# Altium schematic sheet FMU_FMU.SchDoc
size A4; SheetNumber: 1; SheetTotal: 5
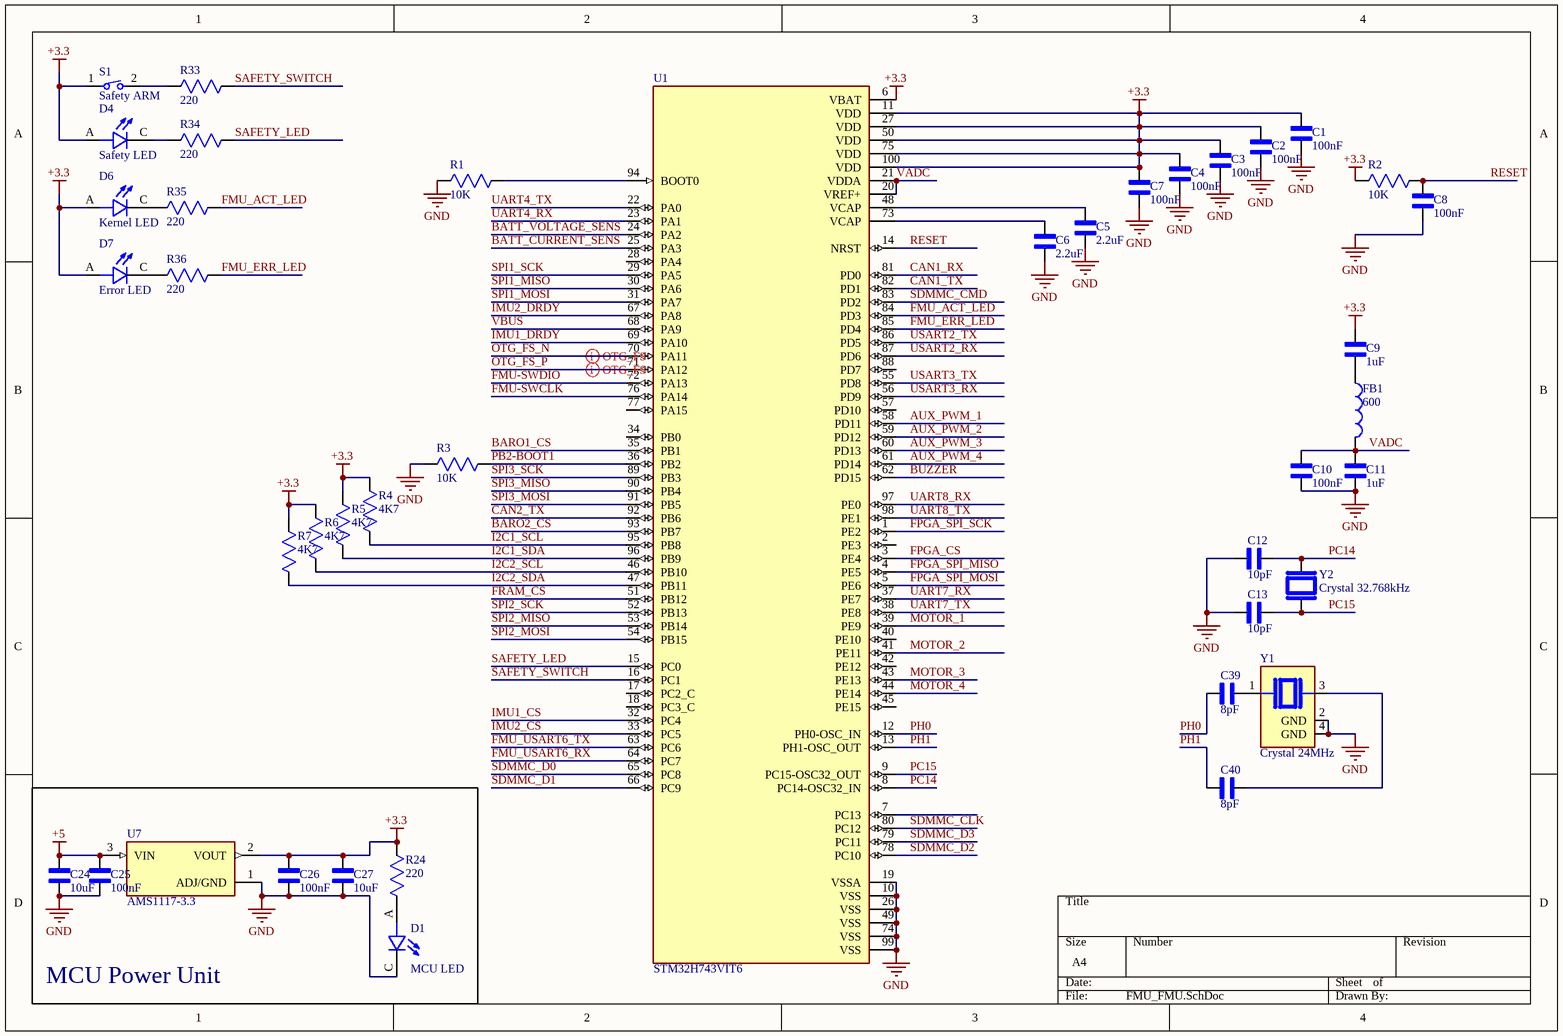
[diagram p0: FMU_FMU.SchDoc]

## Parts
C1  100nF  [CAPC1608X90N]
C2  100nF  [CAPC1608X90N]
C3  100nF  [CAPC1608X90N]
C4  100nF  [CAPC1608X90N]
C5  2.2uF  [CAPC1608X90N]
C6  2.2uF  [CAPC1608X90N]
C7  100nF  [CAPC1608X90N]
C8  100nF  [CAPC3216X127N]
C9  1uF  [CAPC1608X90N]
C10  100nF  [CAPC1608X90N]
C11  1uF  [CAPC1608X90N]
C12  10pF  [CAPC1608X90N]
C13  10pF  [CAPC1608X90N]
C24  10uF  [CAPC3216X110N]
C25  100nF  [CAPC2012X135N]
C26  100nF  [CAPC2012X135N]
C27  10uF  [CAPC3216X110N]
C39  8pF  [CAPC1005X55N]
C40  8pF  [CAPC1005X55N]
D1  MCU LED  [LEDSC125X200X90-2N]
D4  Safety LED  [LEDSC125X200X90-2N]
D6  Kernel LED  [LEDSC125X200X90-2N]
D7  Error LED  [LEDSC125X200X90-2N]
FB1  600  [WE-CBA_0805_W4.0]
R1  10K  [RESC2013X65N]
R2  10K  [RESC2013X65N]
R3  10K  [RESC2013X65N]
R4  4K7  [RESC2013X65N]
R5  4K7  [RESC2013X65N]
R6  4K7  [RESC2013X65N]
R7  4K7  [RESC2013X65N]
R24  220  [RESC2013X65N]
R33  220  [RESC2013X65N]
R34  220  [RESC2013X65N]
R35  220  [RESC2013X65N]
R36  220  [RESC2013X65N]
S1  Safety ARM  [434781025816]
U1  STM32H743VIT6  [QFP50P1600X1600X160-100N]
U7  AMS1117-3.3  [SOT229P700X180-4N]
Y1  Crystal 24MHz  [XTAL_ABM8G-24.000MHZ-B4Y-T]
Y2  Crystal 32.768kHz  [XTAL_CC7V-T1A-32.768KHZ-7PF-100PPM-TA-QC]

## Blocks framed on the sheet
MCU Power Unit: C24-C27 D1 R24 U7

## Nets
+3.3: C1.2 C2.2 C3.2 C4.2 C7.2 C9.2 C26.2 C27.1 D4.A D6.A D7.A R2.2(R2) R4.1(R1) R5.1(R1) R6.1(R1) R7.1(R1) R24.1(R1) S1.1 U1.6(VBAT) U1.11(VDD) U1.27(VDD) U1.50(VDD) U1.75(VDD) U1.100(VDD) U7.2(VOUT)
+5: C24.1 C25.2 U7.3(VIN)
GND: C1.1 C2.1 C3.1 C4.1 C5.1 C6.1 C7.1 C8.1 C10.1 C11.1 C12.2 C13.2 C24.2 C25.1 C26.1 C27.2 D1.C R1.2(R2) R3.2(R2) U1.10(VSS) U1.19(VSSA) U1.26(VSS) U1.49(VSS) U1.74(VSS) U1.99(VSS) U7.1(ADJ/GND) Y1.2(GND) Y1.4(GND)
AUX_PWM_1: U1.58(PD11)
AUX_PWM_2: U1.59(PD12)
AUX_PWM_3: U1.60(PD13)
AUX_PWM_4: U1.61(PD14)
BARO1_CS: U1.35(PB1)
BARO2_CS: U1.93(PB7)
BATT_CURRENT_SENS: U1.25(PA3)
BATT_VOLTAGE_SENS: U1.24(PA2)
BUZZER: U1.62(PD15)
CAN1_RX: U1.81(PD0)
CAN1_TX: U1.82(PD1)
CAN2_TX: U1.92(PB6)
FMU-SWCLK: U1.76(PA14)
FMU-SWDIO: U1.72(PA13)
FMU_ACT_LED: R35.2(R2) U1.84(PD3)
FMU_ERR_LED: R36.2(R2) U1.85(PD4)
FMU_USART6_RX: U1.64(PC7)
FMU_USART6_TX: U1.63(PC6)
FPGA_CS: U1.3(PE4)
FPGA_SPI_MISO: U1.4(PE5)
FPGA_SPI_MOSI: U1.5(PE6)
FPGA_SPI_SCK: U1.1(PE2)
FRAM_CS: U1.51(PB12)
I2C1_SCL: R4.2(R2) U1.95(PB8)
I2C1_SDA: R5.2(R2) U1.96(PB9)
I2C2_SCL: R6.2(R2) U1.46(PB10)
I2C2_SDA: R7.2(R2) U1.47(PB11)
IMU1_CS: U1.32(PC4)
IMU1_DRDY: U1.69(PA10)
IMU2_CS: U1.33(PC5)
IMU2_DRDY: U1.67(PA8)
MOTOR_1: U1.39(PE9)
MOTOR_2: U1.41(PE11)
MOTOR_3: U1.43(PE13)
MOTOR_4: U1.44(PE14)
OTG_FS_N: U1.70(PA11)
OTG_FS_P: U1.71(PA12)
PB2-BOOT1: R3.1(R1) U1.36(PB2)
PC14: C12.1 U1.8(PC14-OSC32_IN) Y2.2
PC15: C13.1 U1.9(PC15-OSC32_OUT) Y2.1
PH0: C39.1 U1.12(PH0-OSC_IN)
PH1: C40.1 U1.13(PH1-OSC_OUT)
RESET: C8.2 R2.1(R1) U1.14(NRST)
SAFETY_LED: R34.2(R2) U1.15(PC0)
SAFETY_SWITCH: R33.2(R2) U1.16(PC1)
SDMMC_CLK: U1.80(PC12)
SDMMC_CMD: U1.83(PD2)
SDMMC_D0: U1.65(PC8)
SDMMC_D1: U1.66(PC9)
SDMMC_D2: U1.78(PC10)
SDMMC_D3: U1.79(PC11)
SPI1_MISO: U1.30(PA6)
SPI1_MOSI: U1.31(PA7)
SPI1_SCK: U1.29(PA5)
SPI2_MISO: U1.53(PB14)
SPI2_MOSI: U1.54(PB15)
SPI2_SCK: U1.52(PB13)
SPI3_MISO: U1.90(PB4)
SPI3_MOSI: U1.91(PB5)
SPI3_SCK: U1.89(PB3)
UART4_RX: U1.23(PA1)
UART4_TX: U1.22(PA0)
UART7_RX: U1.37(PE7)
UART7_TX: U1.38(PE8)
UART8_RX: U1.97(PE0)
UART8_TX: U1.98(PE1)
USART2_RX: U1.87(PD6)
USART2_TX: U1.86(PD5)
USART3_RX: U1.56(PD9)
USART3_TX: U1.55(PD8)
VADC: C10.2 C11.2 FB1.2 U1.20(VREF+) U1.21(VDDA)
VBUS: U1.68(PA9)
NetC5_2: C5.2 U1.48(VCAP)
NetC6_2: C6.2 U1.73(VCAP)
NetC9_1: C9.1 FB1.1
NetC39_2: C39.2 Y1.1
NetC40_2: C40.2 Y1.3
NetD1_A: D1.A R24.2(R2)
NetD4_C: D4.C R34.1(R1)
NetD6_C: D6.C R35.1(R1)
NetD7_C: D7.C R36.1(R1)
NetR1_1: R1.1(R1) U1.94(BOOT0)
NetR33_1: R33.1(R1) S1.2

Not connected (* = marked no-connect by the designer): U1 2(PE3) 7(PC13) 17(PC2_C) 18(PC3_C) 28(PA4) 34(PB0) 40(PE10) 42(PE12) 45(PE15) 57(PD10) 77(PA15) 88(PD7)

## Layout directives
differential pair: OTG_FS_N, OTG_FS_P

## Library data of the parts
C1-C7 C9-C13 = GRM188R71H104KA93D: SMD Capacitor X7R(EIA) with Capacitance: 0.10uF Tol. 10%. Rated Voltage: 50Vdc; MF: Murata; SnapEDA_Link: https://www.snapeda.com/parts/GRM188R71H104KA93D/Murata/view-part/?ref=snap; Package: 1608 Murata; Value: *; MP: GRM188R71H104KA93D; Check_prices: https://www.snapeda.com/parts/GRM188R71H104KA93D/Murata/view-part/?ref=eda
C8 = 12061C104KAT2A: 0.1 ÂµF Â±10% 100V Ceramic Capacitor X7R 1206 (3216 Metric); MF: KYOCERA AVX; SnapEDA_Link: https://www.snapeda.com/parts/12061C104KAT2A/Kyocera/view-part/?ref=snap; Package: 3216 AVX; Value: *; MP: 12061C104KAT2A; Check_prices: https://www.snapeda.com/parts/12061C104KAT2A/Kyocera/view-part/?ref=eda
C24 C27 = T491A106K010AT7280: 10 ÂµF Molded Tantalum Capacitors 10 V 1206 (3216 Metric) 3.8Ohm; MF: KEMET; SnapEDA_Link: https://www.snapeda.com/parts/T491A106K010AT7280/KEMET/view-part/?ref=snap; Package: SMD-2 KEMET; Value: *; MP: T491A106K010AT7280; Check_prices: https://www.snapeda.com/parts/T491A106K010AT7280/KEMET/view-part/?ref=eda
C25 C26 = GRM21BR71H104KA01L: ÐšÐ¾Ð½Ð´ÐµÐ½ÑÐ°Ñ‚Ð¾Ñ€ SMD X7R(EIA) Ñ Ñ‘Ð¼ÐºÐ¾ÑÑ‚ÑŒÑŽ: 0,10 Ð¼ÐºÐ¤ Â± 10%. ÐÐ¾Ð¼Ð¸Ð½Ð°Ð»ÑŒÐ½Ð¾Ðµ Ð½Ð°Ð¿Ñ€ÑÐ¶ÐµÐ½Ð¸Ðµ: 50 Ð’ Ð¿Ð¾ÑÑ‚Ð¾ÑÐ½Ð½Ð¾Ð³Ð¾ Ñ‚Ð¾ÐºÐ°; MF: Murata; SnapEDA_Link: https://www.snapeda.com/parts/GRM21BR71H104KA01L/Murata/view-part/?ref=snap; Package: 805-2 Murata; Value: *; MP: GRM21BR71H104KA01L; Check_prices: https://www.snapeda.com/parts/GRM21BR71H104KA01L/Murata/view-part/?ref=eda
C39 C40 = C1005C0G1H080D050BA: 8 pF Â±0.5pF 50V Ceramic Capacitor C0G, NP0 0402 (1005 Metric); MF: TDK; SnapEDA_Link: https://www.snapeda.com/parts/C1005C0G1H080D050BA/TDK/view-part/?ref=snap; Package: 1005 TDK; Value: *; MP: C1005C0G1H080D050BA; Check_prices: https://www.snapeda.com/parts/C1005C0G1H080D050BA/TDK/view-part/?ref=eda
D1 D4 D6 D7 = 5990110007F: Red 633nm LED Indication - Discrete 2.1V 0805 (2012 Metric); MF: Dialight; MP: 599-0110-007F; Check_prices: https://www.snapeda.com/parts/599-0110-007F/Dialight/view-part/?ref=eda; Value: *; Purchase-URL: https://pricing.snapeda.com/search/part/599-0110-007F/?ref=eda; Price: None; SnapEDA_Link: https://www.snapeda.com/parts/599-0110-007F/Dialight/view-part/?ref=snap; Availability: In Stock; Package: 0805 Dialight
FB1 = WE-CBA_0805: FERRITE BEAD 560 OHM 0805 1LN; MF: WÃ¼rth Elektronik; MP: 782853561; SnapEDA_Link: https://www.snapeda.com/parts/782853561/W%25C3%25BCrth+Elektronik+Midcom/view-part/?ref=snap; Package: 0805 Wurth Elektronik; Value: *; Check_prices: https://www.snapeda.com/parts/782853561/W%25C3%25BCrth+Elektronik+Midcom/view-part/?ref=eda
R1-R7 R24 R33-R36 = RC0805FR-075K1L: 5.1 kOhms Â±1% 0.125W, 1/8W Chip Resistor 0805 (2012 Metric) Moisture Resistant Thick Film; MF: Yageo; MP: RC0805FR075K1L; SnapEDA_Link: https://www.snapeda.com/parts/RC0805FR075K1L/Yageo/view-part/?ref=snap; Package: 0805-2 YAGEO; Value: *; Check_prices: https://www.snapeda.com/parts/RC0805FR075K1L/Yageo/view-part/?ref=eda
S1 = 434781025816: 6.2*4.1mm IP67 vertical type, SMT, height 2.5mm, Black silicone rubber actuator, 160gf, T&R; MF: Wurth Elektronik; SnapEDA_Link: https://www.snapeda.com/parts/434781025816/Wurth+Electronics/view-part/?ref=snap; Package: None; Value: *; MP: 434781025816; Check_prices: https://www.snapeda.com/parts/434781025816/Wurth+Electronics/view-part/?ref=eda
U1 = STM32H743VIT6: ARMÂ® CortexÂ®-M7 STM32H7 Microcontroller IC 32-Bit Single-Core 480MHz 2MB (2M x 8) FLASH 100-LQFP (14x14); MF: STMicroelectronics; SnapEDA_Link: https://www.snapeda.com/parts/STM32H743VIT6/STMicroelectronics/view-part/?ref=snap; Package: LQFP-100 STMicroelectronics; Value: *; MP: STM32H743VIT6; Check_prices: https://www.snapeda.com/parts/STM32H743VIT6/STMicroelectronics/view-part/?ref=eda
U7 = AMS1117-3.3: Linear Voltage Regulator IC Positive Fixed 1 Output 1A SOT-223-3L; MF: UMW; SnapEDA_Link: https://www.snapeda.com/parts/AMS1117-3.3/UMW/view-part/?ref=snap; Package: SOT-223-3L UMW; Value: *; MP: AMS1117-3.3; Check_prices: https://www.snapeda.com/parts/AMS1117-3.3/UMW/view-part/?ref=eda
Y1 = ABM8G-24.000MHZ-B4Y-T: 24 MHz Â±30ppm Crystal 10pF 60 Ohms 4-SMD, No Lead; MF: Abracon; Value: *; SnapEDA_Link: https://www.snapeda.com/parts/ABM8G-24.000MHZ-B4Y-T/Abracon+LLC/view-part/?ref=snap; Availability: In Stock; Price: None; Check_prices: https://www.snapeda.com/parts/ABM8G-24.000MHZ-B4Y-T/Abracon+LLC/view-part/?ref=eda; Purchase-URL: https://pricing.snapeda.com/search/part/ABM8G-24.000MHZ-B4Y-T/?ref=eda; Package: SMD-4 Abracon; MP: ABM8G-24.000MHZ-B4Y-T
Y2 = CC7V-T1A-32.768KHZ-7PF-100PPM-TA-QC: LOW FREQUENCY CRYSTAL; MF: Micro Crystal; Package: SMD-2 Micro Crystal; MP: CC7V-T1A-32.768KHZ-7PF-100PPM-TA-QC; Check_prices: https://www.snapeda.com/parts/CC7V-T1A-32.768KHZ-7PF-100PPM-TA-QC/Micro+Crystal/view-part/?ref=eda; Digi-Key_Part_Number: 2195-CC7V-T1A-32.768KHZ-7PF-100PPM-TA-QCTR-ND; Purchase-URL: https://pricing.snapeda.com/search/part/CC7V-T1A-32.768KHZ-7PF-100PPM-TA-QC/?ref=eda; Value: *; SnapEDA_Link: https://www.snapeda.com/parts/CC7V-T1A-32.768KHZ-7PF-100PPM-TA-QC/Micro+Crystal/view-part/?ref=snap